# Altium schematic sheet POWER_Supply.SchDoc
size A3; SheetNumber: 10; SheetTotal: 16
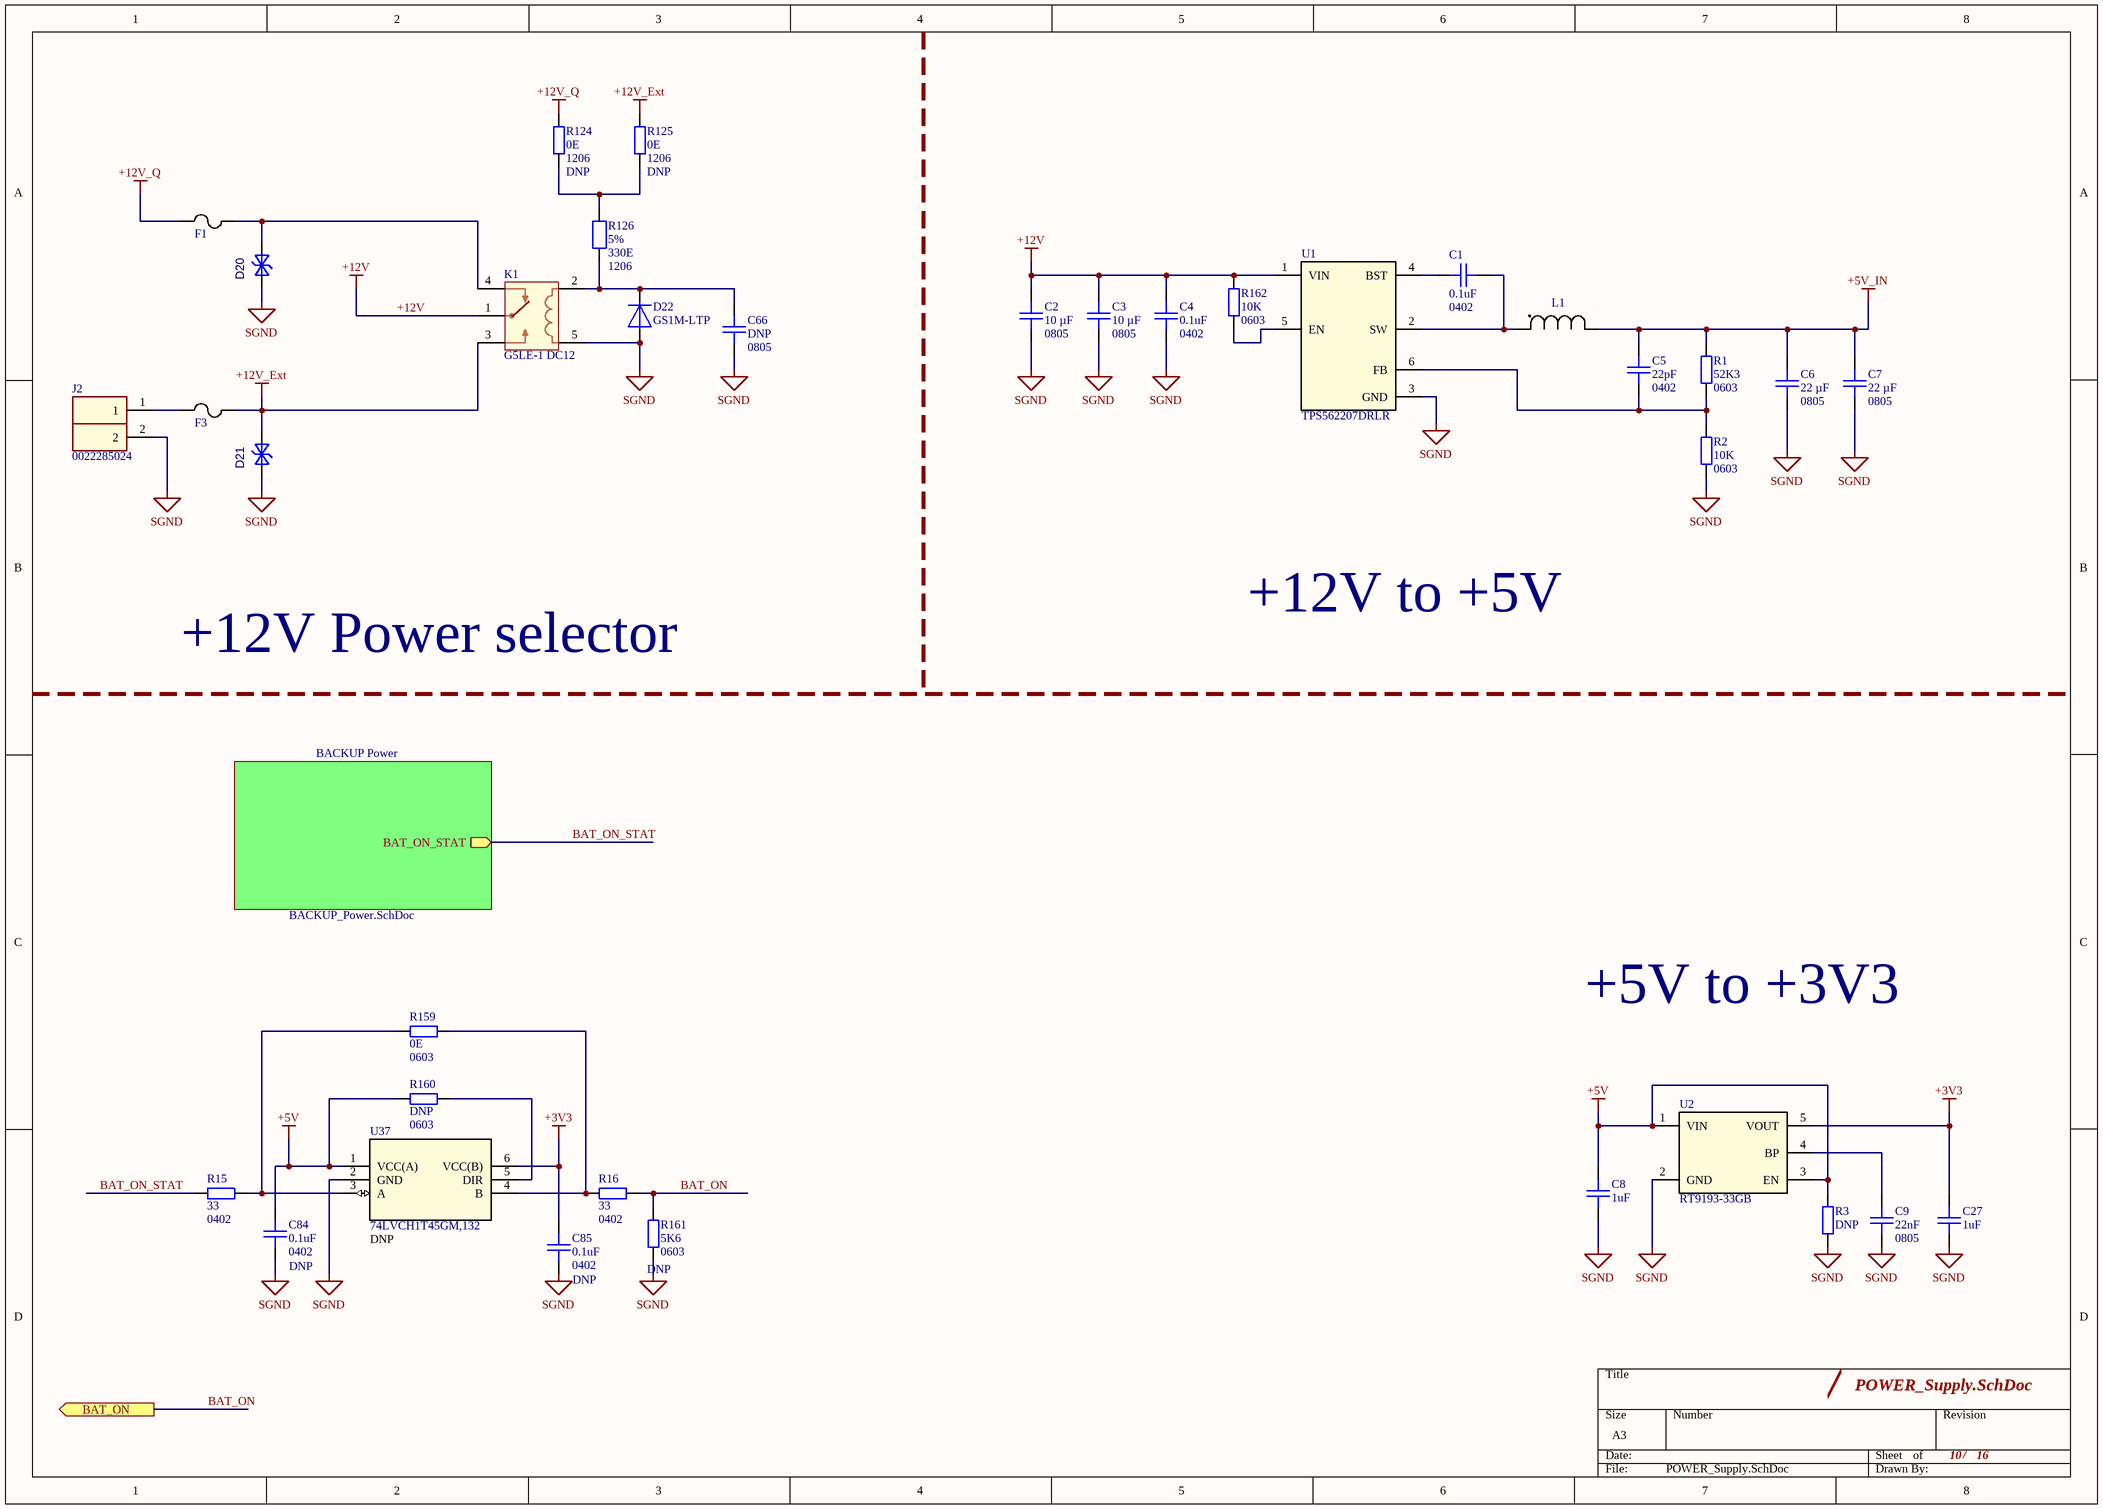
[diagram p0: POWER_Supply.SchDoc]

## Parts
C1  Capacitance: 0.1uF  Package1: 0402  [CAPC100x50x50L25]  (hidden comment: 04023C104KAT2A)
C2  Capacitance: 10 µF  Size2: 0805  [CAPC200X125X125L50]  (hidden comment: CC0805KKX5R8BB106)
C3  Capacitance: 10 µF  Size2: 0805  [CAPC200X125X125L50]  (hidden comment: CC0805KKX5R8BB106)
C4  Capacitance: 0.1uF  Package1: 0402  [CAPC100x50x50L25]  (hidden comment: 04023C104KAT2A)
C5  Capacitance: 22pF  Package1: 0402  [CAPC100x50x50L25]  (hidden comment: CC0402JRNPO9BN220)
C6  Capacitance: 22 µF  Size2: 0805  [CAPC200X125X125L50]  (hidden comment: GRT21BR61E226ME13L)
C7  Capacitance: 22 µF  Size2: 0805  [CAPC200X125X125L50]  (hidden comment: GRT21BR61E226ME13L)
C8  Capacitance: 1uF  [CAPC160X80X90L35]  (hidden comment: 0603YD105KAT2A)
C9  Capacitance: 22nF  SIZE2: 0805  [CAPC200X125X125L50]  (hidden comment: CC0805KRX7R9BB223)
C27  Capacitance: 1uF  [CAPC160X80X90L35]  (hidden comment: 0603YD105KAT2A)
C66  Capacitance: DNP  Size2: 0805  [CAPC200X125X125L50]
C84  Capacitance: 0.1uF  Package1: 0402  [CAPC100x50x50L25]  (hidden comment: DNP)
C85  Capacitance: 0.1uF  Package1: 0402  [CAPC100x50x50L25]  (hidden comment: DNP)
D20  SMAJ14CA-13-F  [SMA]  (value not drawn)
D21  SMAJ14CA-13-F  [SMA]  (value not drawn)
D22  GS1M-LTP  [DIOM520X260X290XL115X145]
F1  0ZCG0200AF2B  [Fuse_1812_ZCG_BEL]  (value not drawn)
F3  0ZCG0200AF2B  [Fuse_1812_ZCG_BEL]  (value not drawn)
J2  0022285024  [PLS-02]
K1  G5LE-1 DC12  [RELAY_G5LE-1 DC5_OMR]
L1  74437349047  [IND_7050-WE-LHMI_WRE]  (value not drawn)
R1  Resistance: 52K3  Size2: 0603  [RESC160X80X55L30]  (hidden comment: RC0603FR-0752K3L)
R2  Resistance: 10K  Size2: 0603  [RESC160X80X55L30]  (hidden comment: RC0603FR-0710KL)
R3  DNP  [RESC100X50X40L25]
R15  Resistance: 33  Package2: 0402  [RESC100X50X40L25]  (hidden comment: RC0402FR-0733RL)
R16  Resistance: 33  Package2: 0402  [RESC100X50X40L25]  (hidden comment: RC0402FR-0733RL)
R124  Resistance: 0E  Size2: 1206  PMNT: DNP  [RESC3116X06N]  (hidden comment: RC1206JR-070RL)
R125  Resistance: 0E  Size2: 1206  PMNT: DNP  [RESC3116X06N]  (hidden comment: RC1206JR-070RL)
R126  Tolerance: 5%  Resistance: 330E  Size: 1206  [RESC3116X06N]  (hidden comment: RC1206JR-07330RL)
R159  Resistance: 0E  Size2: 0603  [RESC160X80X55L30]  (hidden comment: RC0603FR-0710KL)
R160  Size2: 0603  [RESC160X80X55L30]  (hidden comment: DNP)
R161  Resistance: 5K6  Size2: 0603  [RESC160X80X55L30]  (hidden comment: CRCW06035K60JNEA)
R162  Resistance: 10K  Size2: 0603  [RESC160X80X55L30]  (hidden comment: RC0603FR-0710KL)
U1  TPS562207DRLR  [DRL0006A]
U2  RT9193-33GB  [SOT-23-5_RIT]
U37  74LVCH1T45GM,132  PMT: DNP  [74LVCH1T45_XSON6_NEX]

## Sub-sheets
BACKUP Power = BACKUP_Power.SchDoc: BAT_ON_STAT (out)

## Ports
BAT_ON (out)

## Nets
+3V3: C27.2 C85.2 U2.5(VOUT) U37.6(VCC(B))
+5V: C8.2 C84.2 R3.2 R160.2 U2.1(VIN) U2.3(EN) U37.1(VCC(A))
+5V_IN: C5.1 C6.2 C7.2 L1.2 R1.2
+12V: C2.2 C3.2 C4.1 K1.1 R162.1 U1.1(VIN)
+12V_Ext: D21.2(K) F3.2 K1.3 R125.2
+12V_Q: F1.1 R124.2
SGND: C2.1 C3.1 C4.2 C6.1 C7.1 C8.1 C9.1 C27.1 C66.1 C84.1 C85.1 D20.1(A) D21.1(A) D22.2 J2.2 K1.5 R2.1 R3.1 R161.1 U1.3(GND) U2.2(GND) U37.2(GND)
BAT_ON: R16.1 R161.2 ; port BAT_ON
BAT_ON_STAT: R15.2 ; sheet BACKUP Power/BAT_ON_STAT
NetC1_1: C1.1 L1.1 U1.2(SW)
NetC1_2: C1.2 U1.4(BST)
NetC5_2: C5.2 R1.1 R2.2 U1.6(FB)
NetC9_2: C9.2 U2.4(BP)
NetC66_2: C66.2 D22.1 K1.2 R126.2
NetD20_2: D20.2(K) F1.2 K1.4
NetF3_1: F3.1 J2.1
NetR15_1: R15.1 R159.2 U37.3(A)
NetR16_2: R16.2 R159.1 U37.4(B)
NetR124_1: R124.1 R125.1 R126.1
NetR160_1: R160.1 U37.5(DIR)
NetR162_2: R162.2 U1.5(EN)

## Notes on the sheet
- +12V to +5V
- +12V Power selector
- +5V to +3V3
- /

## Library data of the parts
C1 C4 C84 C85 = CMP-001-0374-4: 0402 25V X7R 100 NF 10%; Manufacturer: KYOCERA AVX; Op Temp max: 85°C; Op Temp min: -55°C; ComponentLink3URL: https://www.digikey.com/en/products/detail/yageo/CC0402MRX5R5BB106/5195138; ComponentLink1URL: https://www.yageo.com/upload/media/product/productsearch/datasheet/mlcc/UPY-GPHC_X5R_4V-to-50V_26.pdf; Package: 0402 (1005 Metric); Size: 1.00mm x 0.50mm; Height max: 700µm; Mounting Type: SM; Tolerance: 10%; ComponentLink1Description: Datasheet; ComponentLink3Description: Digikey; Ratings: -; Dielectric: X7R; ComponentLink2Description: Mouser; ComponentLink2URL: https://eu.mouser.com/ProductDetail/YAGEO/CC0402MRX5R5BB106?qs=zEY9bCHj09eCmUJdZuS5Lg%3D%3D; Lead Spacing: 0mm; Component Type: Ceramic Capacitor; Voltage Rating: 25V
  C1 C4: MPN: 04023C104KAT2A
  C84 C85: MPN: DNP; DNP: DNP
C2 C3 = CMP-001-1415-2: CAP CER 10UF 25V X5R 0805; Manufacturer: YAGEO; Op Temp max: 125°C; Op Temp min: -55°C; Tolerance: ±10%; Voltage Rating: 25V; Mounting Type: SM; MPN: CC0805KKX5R8BB106; Package: 0805 (2012 Metric); Dielectric: X5R; ComponentLink3Description: Digikey; ComponentLink1Description: Datasheet; Component Type: Ceramic Capacitor
  C2: ComponentLink1URL: https://www.yageo.com/upload/media/product/app/datasheet/mlcc/upy-gphc_x7r_6_3v-to-250v.pdf; ComponentLink3URL: https://www.digikey.ee/en/products/detail/yageo/cc0805krx7r9bb223/302872
  C3: ComponentLink1URL: https://www.yageo.com/upload/media/product/app/datasheet/mlcc/upy-gphc_x5r_4v-to-50v.pdf; ComponentLink3URL: https://www.digikey.com/en/products/detail/yageo/CC0805KKX5R8BB106/5195275
C5 = CMP-001-0374-4: CAP CER 22PF 50V C0G/NPO 0402; Manufacturer: YAGEO; Op Temp max: 125°C; Op Temp min: -55°C; Tolerance: 5%; Dielectric: C0G, NP0; ComponentLink3URL: https://www.digikey.com/en/products/detail/yageo/CC0402JRNPO9BN220/302752; MPN: CC0402JRNPO9BN220; ComponentLink1URL: https://www.yageo.com/upload/media/product/productsearch/datasheet/mlcc/UPY-GP_NP0_16V-to-50V_18.pdf; Package: 0402 (1005 Metric); Size: 1.00mm x 0.50mm; Height max: 700µm; Mounting Type: SM; ComponentLink1Description: Datasheet; ComponentLink3Description: Digikey; Ratings: -; Lead Spacing: 0mm; Component Type: Ceramic Capacitor; Voltage Rating: 50V
C6 C7 = CMP-001-1415-2: CAP CER 22UF 25V X5R 0805; Manufacturer: YAGEO; Op Temp max: 125°C; Op Temp min: -55°C; Tolerance: ±20%; Voltage Rating: 25V; ComponentLink1URL: https://search.murata.co.jp/Ceramy/image/img/A01X/G101/ENG/GRT21BR61E226ME13-01.pdf; ComponentLink3URL: https://www.digikey.com/en/products/detail/murata-electronics/GRT21BR61E226ME13L/5416811; Mounting Type: SM; MPN: GRT21BR61E226ME13L; Package: 0805 (2012 Metric); Dielectric: X5R; ComponentLink3Description: Digikey; ComponentLink1Description: Datasheet; Component Type: Ceramic Capacitor
C8 C27 = CMP-00119-5: CAP CER 1UF 16V X5R 0603; Manufacturer: KYOCERA AVX; Op Temp min: -55°C; Op Temp max: 85°C; Tolerance: 10%; ComponentLink1Description: Datasheet; MPN: 0603YD105KAT2A; ComponentLink2Description: Mouser; Ratings: -; Size: 1.60mm x 0.80mm; ComponentLink1URL: https://eu.mouser.com/datasheet/2/40/cx5r_KGM-3223198.pdf; Package: 0603 (1608 Metric); Dielectric: X5R; Voltage Rating: 16V; ComponentLink2URL: https://eu.mouser.com/ProductDetail/KYOCERA-AVX/0603YD105KAT2A?qs=Gc704lYbI0yxwip%252B5td8dA%3D%3D; Mounting Type: SM; Component Type: Ceramic Capacitor
C9 = CMP-001-1415-2: CAP CER 0.022UF 50V X7R 0805; MPN: CL21B104KBCNNNC; Manufacturer: Samsung Electro-Mechanics; Op Temp max: 125°C; Op Temp min: -55°C; Tolerance: ±10%; Voltage Rating: 50V; ComponentLink1URL: https://www.yageo.com/upload/media/product/app/datasheet/mlcc/upy-gphc_x7r_6_3v-to-250v.pdf; ComponentLink3URL: https://www.digikey.ee/en/products/detail/yageo/cc0805krx7r9bb223/302872; Mounting Type: SM; Package: 0805 (2012 Metric); Dielectric: X7R; ComponentLink3Description: Digikey; ComponentLink1Description: Datasheet; Ratings: -; Component Type: Ceramic Capacitor
C66 = CMP-001-1415-2: CAP CER ???? 50V X7R 0805; Manufacturer: Samsung Electro-Mechanics; Op Temp max: 125°C; Op Temp min: -55°C; Tolerance: ±10%; Voltage Rating: 50V; ComponentLink1URL: https://www.yageo.com/upload/media/product/app/datasheet/mlcc/upy-gphc_x7r_6_3v-to-250v.pdf; ComponentLink3URL: https://www.digikey.ee/en/products/detail/yageo/cc0805krx7r9bb223/302872; Mounting Type: SM; Package: 0805 (2012 Metric); Dielectric: X7R; ComponentLink3Description: Digikey; ComponentLink1Description: Datasheet; Component Type: Ceramic Capacitor; DNP: DNP
D20 D21 = SMAJ*C: TVS DIODE 14VWM 23.2VC SMA; MPN: SMAJ14CA-13-F
D22 = GS1M-LTP: DIODE GEN PURP 1KV 1A DO214AC; Manufacturer: Micro Commercial Co; Voltage - Forward (Vf) (Max) @ If: 1.1 V @ 1 A; Capacitance: 15pF @ 4V, 1MHz; Voltage - DC Reverse (Vr) (Max): 1000 V; Mounting Type: SM; ComponentLink3Description: Digikey; ComponentLink1Description: Datasheet; Diode Type: Diode; ComponentLink1URL: https://www.smc-diodes.com/propdf/1N4001FL-1N4007FL%20N1646%20REV.A.pdf; Package: DO-214AC, SMA; ComponentLink3URL: https://www.digikey.com/en/products/detail/micro-commercial-co/GS1M-LTP/2213582; Current - Average Rectified (Io): 1A; MPN: GS1M-LTP
F1 F3 = 0ZCG0200AF2B: PTC RESET FUSE 16V 2A 1812; Mfr_Name: Belfuse; Current - Trip (It): 3.5A; Resistance - Initial (Ri) (Min): 20 mOhms; Current - Hold (Ih) (Max): 2 A; MPN: 0ZCG0200AF2B; Voltage - Max: 16V; ComponentLink1Description: DigiKey; ComponentLink1URL: https://www.digikey.pl/en/products/detail/bel-fuse-inc/0ZCG0200AF2B/6210545; ComponentLink2Description: Datasheet; ComponentLink2URL: https://www.belfuse.com/resources/datasheets/circuitprotection/ds-cp-0zcg-series.pdf
J2 = PLS_02: CONN HEADER VERT 2POS 2.54MM; MAnufacturer: MOLEX; MPN: 0022285024
K1 = G5LE-1 DC12: RELAY GEN PURPOSE SPDT 10A 12V; Mfr_Name: Omron Electronics Inc-EMC Div; Copyright: Copyright (C) 2024 Ultra Librarian. All rights reserved.; MPN: G5LE-1 DC12; RefDes: RefDes; Type: DEV
L1 = IND_WE_74437349047: FIXED IND 4.7UH 5A 30.8 MOHM SMD; Mfr_Name: Wurth Electronics; Inductance: 4.7 µH; Current - Saturation (Isat): 11A; DC Resistance (DCR): 30.8mOhm Max; Manufacturer_Part_Number: 74437349047; Current Rating (Amps): 5 A; ComponentLink1Description: Datasheet; ComponentLink1URL: https://we-online.com/components/products/datasheet/74437349047.pdf; ComponentLink2Description: DigiKey; ComponentLink2URL: https://www.digikey.com/en/products/detail/w%C3%BCrth-elektronik/74437349047/2790977
R1 = CMP-001-0628-7: RES 52.3 KOHM 1% 1/10W 0603; Manufacturer: YAGEO; Power: 100mW; Temperature Coefficient: ±100ppm; Op Temp max: 155°C; Op Temp min: -55°C; Ratings: -; ComponentLink3URL: https://www.digikey.com/en/products/detail/yageo/RC0603FR-0710KL/726880?s=N4IgTCBcDaIEoGEAMA2JBmAYnAtEg7AIxIDSAMiALoC%2BQA; Size: 1.60mm x 0.80mm; ComponentLink1Description: Datasheet; ComponentLink3Description: Digikey; ComponentLink2Description: Mouser; ComponentLink1URL: https://www.yageo.com/upload/media/product/products/datasheet/rchip/PYu-RC_51_RoHS_P_4.pdf; Composition: Thick Film; Package: 0603 (1608 Metric); ComponentLink2URL: https://eu.mouser.com/ProductDetail/YAGEO/RC0603FR-0710KL?qs=grNVn54RoB%252B3GtjbJj3wJQ%3D%3D; Mounting Type: SM; Tolerance: 1%; Height max: 550µm; MPN: RC0603FR-0752K3L; Component Type: Chip Resistor
R2 R162 = CMP-001-0628-7: RES 10K OHM 1% 1/10W 0603; Manufacturer: YAGEO; Power: 100mW; Temperature Coefficient: ±100ppm; Op Temp max: 155°C; Op Temp min: -55°C; PMNT: DNP; Ratings: -; ComponentLink3URL: https://www.digikey.com/en/products/detail/yageo/RC0603FR-0710KL/726880?s=N4IgTCBcDaIEoGEAMA2JBmAYnAtEg7AIxIDSAMiALoC%2BQA; Size: 1.60mm x 0.80mm; ComponentLink1Description: Datasheet; ComponentLink3Description: Digikey; ComponentLink2Description: Mouser; ComponentLink1URL: https://www.yageo.com/upload/media/product/products/datasheet/rchip/PYu-RC_51_RoHS_P_4.pdf; Composition: Thick Film; Package: 0603 (1608 Metric); ComponentLink2URL: https://eu.mouser.com/ProductDetail/YAGEO/RC0603FR-0710KL?qs=grNVn54RoB%252B3GtjbJj3wJQ%3D%3D; Mounting Type: SM; Tolerance: 1%; Height max: 550µm; MPN: RC0603FR-0710KL; Component Type: Chip Resistor
R3 = CMP-001-0484-6: RES SMD 0 OHM JUMPER 1/16W 0402; Manufacturer: YAGEO; Power: 63mW; Op Temp min: -55°C; Temperature Coefficient: ±100ppm; Resistance: 0; Op Temp max: 155°C; ComponentLink3URL: https://www.digikey.com/en/products/detail/yageo/RC0402FR-0727RL/5280946; ComponentLink2Description: Mouser; Ratings: -; Tolerance: Jumper; Height max: 400µm; MPN: DNP; ComponentLink1URL: https://www.yageo.com/upload/media/product/productsearch/datasheet/rchip/PYu-RC_Group_51_RoHS_L_12.pdf; Size: 1.00mm x 0.50mm; Composition: Thick Film; Package: 0402 (1005 Metric); ComponentLink3Description: Digikey; Mounting Type: SM; ComponentLink2URL: https://eu.mouser.com/ProductDetail/YAGEO/RC0402FR-0727RL?qs=UOUeRUa%252B8Wlb37UyFHw9Bw%3D%3D; ComponentLink1Description: Datasheet; Component Type: Chip Resistor
R15 R16 = CMP-001-0484-6: RES 33 OHM 1% 1/16W 0402; Manufacturer: YAGEO; Power: 63mW; Op Temp min: -55°C; Temperature Coefficient: ±100ppm; Op Temp max: 155°C; ComponentLink3URL: https://www.digikey.com/en/products/detail/yageo/RC0402FR-0727RL/5280946; ComponentLink2Description: Mouser; Ratings: -; Tolerance: 1%; Height max: 400µm; MPN: RC0402FR-0733RL; ComponentLink1URL: https://www.yageo.com/upload/media/product/productsearch/datasheet/rchip/PYu-RC_Group_51_RoHS_L_12.pdf; Size: 1.00mm x 0.50mm; Composition: Thick Film; Package: 0402 (1005 Metric); ComponentLink3Description: Digikey; Mounting Type: SM; ComponentLink2URL: https://eu.mouser.com/ProductDetail/YAGEO/RC0402FR-0727RL?qs=UOUeRUa%252B8Wlb37UyFHw9Bw%3D%3D; ComponentLink1Description: Datasheet; Component Type: Chip Resistor
R124 R125 = RC_1206: RES 0 OHM JUMPER 1/4W 1206; MF: YAGEO; Power: 0.25W; Datasheet: https://www.yageo.com/upload/media/product/products/datasheet/rchip/PYu-RC_Group_51_RoHS_L_12.pdf; DigiKey: https://www.digikey.com/en/products/detail/yageo/RC1206JR-070RL/729184; Package: 1206 (3216 Metric); MPN: RC1206JR-070RL; DNP: DNP
R126 = RT1206BRD07100RL: RES 330 OHM 5% 1/4W 1206; MF: YAGEO; Power: 0.25W; Datasheet: https://www.yageo.com/upload/media/product/app/datasheet/rchip/pyu-rt_1-to-0.01_rohs_l.pdf; DigiKey: https://www.digikey.sk/en/products/detail/yageo/RT1206BRD07130RL/1079510; Package: 1206 (3216 Metric); MPN: RC1206JR-07330RL
R159 = CMP-001-0628-7: RES 0 OHM JUMPER 1/10W 0603; Manufacturer: YAGEO; Power: 100mW; Temperature Coefficient: ±100ppm; Tolerance: 1%; Op Temp max: 155°C; Op Temp min: -55°C; PMNT: DNP; Ratings: -; ComponentLink3URL: https://www.digikey.com/en/products/detail/yageo/RC0603FR-0710KL/726880?s=N4IgTCBcDaIEoGEAMA2JBmAYnAtEg7AIxIDSAMiALoC%2BQA; Size: 1.60mm x 0.80mm; ComponentLink1Description: Datasheet; ComponentLink3Description: Digikey; ComponentLink2Description: Mouser; ComponentLink1URL: https://www.yageo.com/upload/media/product/products/datasheet/rchip/PYu-RC_51_RoHS_P_4.pdf; Composition: Thick Film; Package: 0603 (1608 Metric); ComponentLink2URL: https://eu.mouser.com/ProductDetail/YAGEO/RC0603FR-0710KL?qs=grNVn54RoB%252B3GtjbJj3wJQ%3D%3D; Mounting Type: SM; Height max: 550µm; MPN: RC0603FR-0710KL; Component Type: Chip Resistor
R160 = CMP-001-0628-7: RES 0 OHM JUMPER 1/10W 0603; Manufacturer: YAGEO; MPN: RC0603FR-0710KL; Power: 100mW; Temperature Coefficient: ±100ppm; Tolerance: 1%; Op Temp max: 155°C; Op Temp min: -55°C; Ratings: -; ComponentLink3URL: https://www.digikey.com/en/products/detail/yageo/RC0603FR-0710KL/726880?s=N4IgTCBcDaIEoGEAMA2JBmAYnAtEg7AIxIDSAMiALoC%2BQA; Size: 1.60mm x 0.80mm; ComponentLink1Description: Datasheet; ComponentLink3Description: Digikey; ComponentLink2Description: Mouser; ComponentLink1URL: https://www.yageo.com/upload/media/product/products/datasheet/rchip/PYu-RC_51_RoHS_P_4.pdf; Resistance: DNP; Composition: Thick Film; Package: 0603 (1608 Metric); ComponentLink2URL: https://eu.mouser.com/ProductDetail/YAGEO/RC0603FR-0710KL?qs=grNVn54RoB%252B3GtjbJj3wJQ%3D%3D; Mounting Type: SM; Height max: 550µm; Component Type: Chip Resistor; PMNT: DNP; DNP: DNP
R161 = CMP-001-0628-7: RES SMD 5.6K OHM 5% 1/10W 0603; Manufacturer: YAGEO; MPN: DNP; Power: 100mW; Temperature Coefficient: ±100ppm; Tolerance: 1%; Op Temp max: 155°C; Op Temp min: -55°C; Ratings: -; ComponentLink3URL: https://www.digikey.com/en/products/detail/yageo/RC0603FR-0710KL/726880?s=N4IgTCBcDaIEoGEAMA2JBmAYnAtEg7AIxIDSAMiALoC%2BQA; Size: 1.60mm x 0.80mm; ComponentLink1Description: Datasheet; ComponentLink3Description: Digikey; ComponentLink2Description: Mouser; ComponentLink1URL: https://www.yageo.com/upload/media/product/products/datasheet/rchip/PYu-RC_51_RoHS_P_4.pdf; Composition: Thick Film; Package: 0603 (1608 Metric); ComponentLink2URL: https://eu.mouser.com/ProductDetail/YAGEO/RC0603FR-0710KL?qs=grNVn54RoB%252B3GtjbJj3wJQ%3D%3D; Mounting Type: SM; Height max: 550µm; Component Type: Chip Resistor; DNP: DNP
U1 = TPS562207DRLR: IC REG BUCK ADJ 2A SOT563; Mfr_Name: Texas Instruments; Voltage - Input (Max): 17V; Voltage - Input (Min): 4.3V; Frequency - Switching: 580kHz; Current - Output: 2A; MPN: TPS562207DRLR; ComponentLink1Description: DigiKey; ComponentLink1URL: https://www.digikey.com/en/products/detail/texas-instruments/tps562207drlr/13213542
U2 = RT9193-33GB: IC REG LINEAR 3.3V 300MA SOT23-5; Mfr_Name: Richtek Technology; MPN: RT9193-33GB
U37 = 74LVCH1T45GM,132: IC TRANSLTR BIDIRECTIONAL 6XSON; Voltage min: 1.2 V; Moltage max: 5.5 V; MPN: 74LVCH1T45GM,132; DNP: DNP